# EasyEDA Pro project wzh2814685-voltpen_v0-5-3f4d7379.epro, board C115支架_板厚0.8
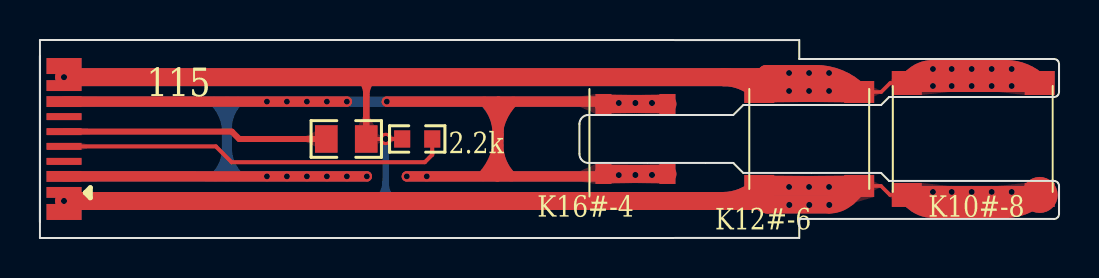
[diagram p3: board, top side]
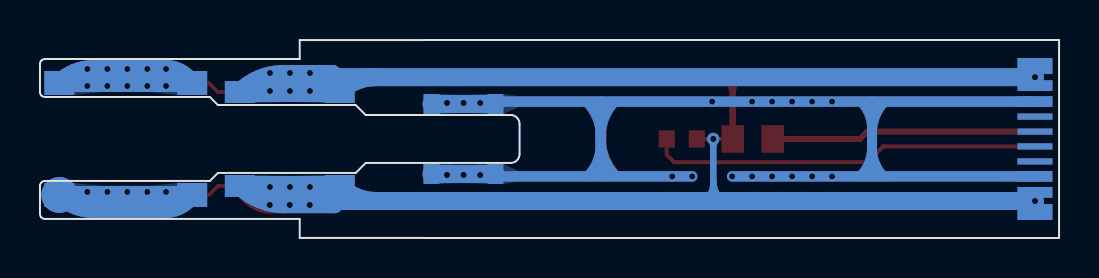
[diagram p4: board, bottom side, seen from below]

Outline 51 x 9.91 mm; copper layers: Top Layer, Bottom Layer. Coordinates in mm from the lower left corner of the outline.
Outline path: 0,9.91 0,0 38,0 38,0.95 50.75,0.95 arc(50.93,1.03) 51,1.2 51,2.6 arc(50.93,2.78) 50.75,2.85 42.5,2.85 42.1,3.25 35.2,3.25 34.7,3.75 27.45,3.75 arc(27.13,3.89) 27,4.2 27,5.7 arc(27.13,6.02) 27.45,6.15 34.7,6.15 35.2,6.65 42.1,6.65 42.5,7.05 50.75,7.05 arc(50.93,7.13) 51,7.3 51,8.7 arc(50.93,8.88) 50.75,8.95 38,8.95 38,9.9 0,9.91
Stack: Top Layer 0.035mm / Dielectric1 1.51mm FR4 er 4.5 / Bottom Layer 0.035mm

## Design rules (mm)
spacing safeClearance (default): track to track 0.152, other pairs 0.152 to 0.3
spacing Plane_innerPlane: track to track 0.152, other pairs 0.152 to 0.3
spacing Copper_copperRegion: track to track 0.152, other pairs 0.152 to 0.3
track width trackWidth (default): min 0.127, default 0.254, max 2.54
differential pair differentialPair (default): width min 0.127, default 0.254, max 2.54; gap min 0.152, default 0.152

## Placement (name value [footprint] x y rotation side)
NOREF  -  [Pad_e62]  36 2.6 0 top
NOREF#2  -  [Pad_e64]  43.38 7.75 0 top
NOREF#3  -  [Pad_e67]  41 2.6 0 top
NOREF#4  -  [Pad_e58]  31.41 6.7 90 top
NOREF#5  -  [Pad_e73]  31.4 3.2 90 top
NOREF#6  -  [Pad_e56]  28.21 3.2 90 top
NOREF#7  -  [Pad_e63]  50.03 7.75 0 top
NOREF#8  -  [Pad_e74]  31.4 6.7 90 top
NOREF#9  -  [Pad_e70]  36 2.6 0 top
NOREF#10  -  [Pad_e52]  43.38 2.15 0 top
NOREF#11  -  [Pad_e68]  41 7.3 0 top
NOREF#12  -  [Pad_e72]  28.2 6.7 90 top
NOREF#13  -  [Pad_e71]  28.2 3.2 90 top
NOREF#14  -  [Pad_e51]  50.03 2.15 0 top
NOREF#15  -  [Pad_e69]  36 7.31 0 top
NOREF#16  -  [Pad_e59]  41 2.6 0 top
NOREF#17  -  [Pad_e57]  28.21 6.7 90 top
NOREF#18  -  [Pad_e61]  36 7.31 0 top
NOREF#19  -  [Pad_e60]  41 7.3 0 top
NOREF#20  -  [Pad_e54]  50.03 7.75 0 top
NOREF#21  -  [Pad_e53]  43.38 7.75 0 top
NOREF#22  -  [Pad_e55]  31.41 3.2 90 top
NOREF#23  -  [Pad_e65]  43.38 2.15 0 top
NOREF#24  -  [Pad_e66]  50.03 2.15 0 top
R1  10kΩ  [R0603]  18.88 4.95 0 top
S1  -  [R0805]  15.33 4.95 180 top
USB4  TYPE-C-16简化 公头  [TYPE-C-16P简化 公头]  0 4.95 90 top

## Footprints (pads in the part's own frame, mm; a bottom-side part is the same pattern mirrored in y, then rotated)
Pad_e51
  rect 1.5x1.2 smd far side: (0,0)
Pad_e52
  rect 1.5x1.2 smd far side: (0,0)
Pad_e53
  rect 1.5x1.2 smd far side: (0,0)
Pad_e54
  rect 1.5x1.2 smd far side: (0,0)
Pad_e55
  rect 1x0.8 smd far side: 42(0,0)
Pad_e56
  rect 1x0.8 smd far side: 42(0,0)
Pad_e57
  rect 1x0.8 smd far side: 42(0,0)
Pad_e58
  rect 1x0.8 smd far side: 42(0,0)
Pad_e59
  custom 0x0 smd far side: (0,0)
Pad_e60
  custom 0x0 smd far side: VCT1(0,0)
Pad_e61
  rect 1.5x1.1 smd far side: (0,0)
Pad_e62
  rect 1.5x1.1 smd far side: (0,0)
Pad_e63
  rect 1.5x1.2 smd: (0,0)
Pad_e64
  rect 1.5x1.2 smd: (0,0)
Pad_e65
  rect 1.5x1.2 smd: (0,0)
Pad_e66
  rect 1.5x1.2 smd: (0,0)
Pad_e67
  custom 0x0 smd: (0,0)
Pad_e68
  rect 1.5x1.1 smd: (0,0)
Pad_e69
  rect 1.5x1.1 smd: (0,0)
Pad_e70
  rect 1.5x1.1 smd: (0,0)
Pad_e71
  rect 1x0.8 smd: 42(0,0)
Pad_e72
  rect 1x0.8 smd: 42(0,0)
Pad_e73
  rect 1x0.8 smd: 42(0,0)
Pad_e74
  rect 1x0.8 smd: 42(0,0)
R0603
  rect 0.806x0.864 smd: 1(-0.753,0) 2(0.753,0)
R0805
  rect 1.133x1.377 smd: 1(-1,0) 2(1,0)
TYPE-C-16P简化 公头
  rect 0.8x1.75 smd: 0(-3.65,-1.2) 0(3.65,-1.2)
  rect 0.8x1.75 smd far side: 0(-3.65,-1.2) 0(3.65,-1.2)
  rect 0.54x1.75 smd: A1(-2.67,-1.2) A4(-1.87,-1.2) A9(1.87,-1.2) A12(2.67,-1.2)
  rect 0.35x1.75 smd: A5(-1.12,-1.2) A6(-0.37,-1.2) A7(0.37,-1.2) A8(1.12,-1.2)
  rect 0.54x1.75 smd far side: B1(2.67,-1.2) B4(1.87,-1.2) B9(-1.87,-1.2) B12(-2.67,-1.2)
  rect 0.3x1.75 smd far side: B5(1.12,-1.2) B6(0.37,-1.2) B7(-0.37,-1.2) B8(-1.12,-1.2)

## Nets
GND: NOREF. NOREF#2. NOREF#3. NOREF#7. NOREF#9. NOREF#10. NOREF#11. NOREF#14. NOREF#15. NOREF#16. NOREF#18. NOREF#19.VCT1 NOREF#20. NOREF#21. NOREF#23. NOREF#24. R1.1 S1.1 USB4.0 USB4.A1 USB4.A12 USB4.B1 USB4.B12
H_ID: R1.2 USB4.A6
H_ID2: USB4.B6
SLP: S1.2 USB4.A7
SLP2: USB4.B7
TEMP: NOREF#4.42 NOREF#5.42 NOREF#6.42 NOREF#8.42 NOREF#12.42 NOREF#13.42 NOREF#17.42 NOREF#22.42 USB4.A4 USB4.A9 USB4.B4 USB4.B9

Pads without a net: USB4 A5 A8 B5 B8

## Via types
v1: diameter 0.5, hole 0.3, Top Layer to Bottom Layer, 14 vias
v2: diameter 0.62, hole 0.31, Top Layer to Bottom Layer, 10 vias
v3: diameter 0.61, hole 0.305, Top Layer to Bottom Layer, 2 vias
v4: diameter 0.6, hole 0.3, Top Layer to Bottom Layer, 24 vias

## Routing (per net, layer and track width the routed paths; a pad name or vN(x,y) marks a point on that pad's centre or on a via; arc(x,y) is an arc through that point)
GND: length 237.5
  Top Layer w0.18: 41,2.61 42.09,2.61 42.54,2.16 43.38,2.16 ; 1.2,7.62 1.2,8.6 ; 1.2,2.28 1.2,1.3 ; 43.38,7.75 42.55,7.75 42.1,7.3 41,7.3
  Top Layer w0.2: 18.13,4.95 v2(17.3,4.95) 16.33,4.95
  Top Layer w0.3: 16.33,4.95 16.33,7.06 ; 16.33,4.95 16.33,7.15 ; 16.33,4.95 16.33,7.99
  Top Layer w0.9: 36.42,1.67 39.5,1.67 ; 48.34,1.45 44.69,1.45 ; v2(1.2,1.85) 35.94,1.85 ; 36.36,8.2 38.83,8.2 ; 43.38,7.75 50.03,7.75 ; 50.03,2.16 43.38,2.16 43.65,1.88 ; 34.21,8.05 v2(1.2,8.05) ; 44.69,8.45 48.34,8.45 ; 40.43,2.04 41,2.61 ; 43.38,7.75 43.65,8.02 ; 34.21,8.05 35.98,8.05
  Top Layer w1: 36,2.61 41,2.61 ; 36,7.3 41,7.3
  Bottom Layer w0.18: 1.2,2.28 1.2,1.3
  Bottom Layer w0.3: v2(17.3,4.95) 17.3,2.94 ; v2(17.3,4.95) 17.3,2.81 ; v2(17.3,4.95) 17.3,1.85
  Bottom Layer w0.9: 43.65,1.88 43.38,2.15 50.03,2.16 ; 36.37,8.2 38.82,8.2 ; 35.89,1.85 v2(1.2,1.85) ; 36.27,1.69 38.8,1.69 ; 50.03,7.75 43.38,7.75 43.65,8.02 ; 44.69,8.45 48.34,8.45 ; 35.99,8.05 v2(1.2,8.05) ; 48.34,1.45 44.69,1.45
  Bottom Layer w1: 36,2.61 41,2.61 ; 36,7.3 41,7.3
  vias: v2(37.5,1.65) v2(38.5,1.65) v2(39.5,1.65) v4(37.49,8.25) v4(37.49,7.35) v4(37.49,2.55) v4(38.49,8.25) v4(38.49,7.35) v4(38.49,2.55) v4(39.49,8.25) v4(39.49,7.35) v4(39.49,2.55) v4(44.69,8.45) v4(44.69,7.6) v4(44.69,2.3) v4(45.63,8.45) v4(45.63,7.6) v4(45.63,2.3) v4(46.63,8.45) v4(46.63,7.6) v4(46.63,2.3) v4(47.63,8.45) v4(47.63,7.6) v4(47.63,2.3) v4(48.63,8.45) v4(48.63,7.6) v4(48.63,2.3)
H_ID: length 19.7
  Top Layer w0.2: 19.63,4.95 19.63,4.17 19.26,3.79 9.59,3.79 8.8,4.58 USB4.A6
SLP: length 13.3
  Top Layer w0.3: USB4.A7 9.6,5.32 9.97,4.95 S1.2
TEMP: length 159.5
  Top Layer w0.5: 22.89,3.08 22.89,5.26 ; 22.89,3.08 22.89,4.89 ; 22.89,3.08 22.95,6.82 ; 22.89,3.08 22.89,5.08 ; 22.95,6.82 22.95,5.21 ; 22.95,6.82 22.95,4.64 ; NOREF#13.42 NOREF#5.42 ; NOREF#12.42 NOREF#8.42
  Top Layer w0.52: NOREF#12.42 28.2,6.82 17.36,6.82 ; NOREF#13.42 28.2,3.08 v1(18.36,3.08) ; 1.2,6.82 15.36,6.82 ; 1.2,3.09 v1(16.36,3.08)
  Top Layer w0.9: NOREF#13.42 NOREF#5.42 ; NOREF#12.42 NOREF#8.42
  Bottom Layer w0.5: 22.93,3.3 22.93,5.11 ; 22.93,3.3 22.93,6.82 ; 22.93,3.3 22.93,5.11 ; 22.93,6.82 22.93,4.67 ; 22.93,6.82 22.93,4.93 ; 9.36,3.08 9.36,6.82 ; 9.36,3.08 9.36,5.29 ; 9.36,3.08 9.36,5.5 ; 9.36,6.82 9.36,4.5 ; 9.36,6.82 9.36,4.47
  Bottom Layer w0.52: 1.2,6.82 28.21,6.82 28.21,6.7 ; v1(18.36,3.08) 28.21,3.08 NOREF#6.42 ; 1.2,3.09 v1(16.36,3.08)
  Bottom Layer w0.9: NOREF#6.42 NOREF#22.42 ; NOREF#17.42 NOREF#4.42
  vias: v1(11.36,6.82) v1(11.36,3.08) v1(12.36,6.82) v1(12.36,3.08) v1(13.36,6.82) v1(13.36,3.08) v1(14.36,6.82) v1(14.36,3.08) v1(15.36,6.82) v1(15.36,3.08) v1(17.36,6.82) v1(19.36,3.08) v2(29.8,6.75) v2(29.8,3.15) v2(30.63,6.75) v2(30.63,3.15) v3(28.97,6.75) v3(28.97,3.15)

Small or netless copper shapes (teardrops, artwork), in the pictures only: 54 on Top Layer, 23 on Bottom Layer

## Text on the board
Top Silkscreen Layer: 2.2k | K16#-4 | K12#-6 | K10#-8 | 115
